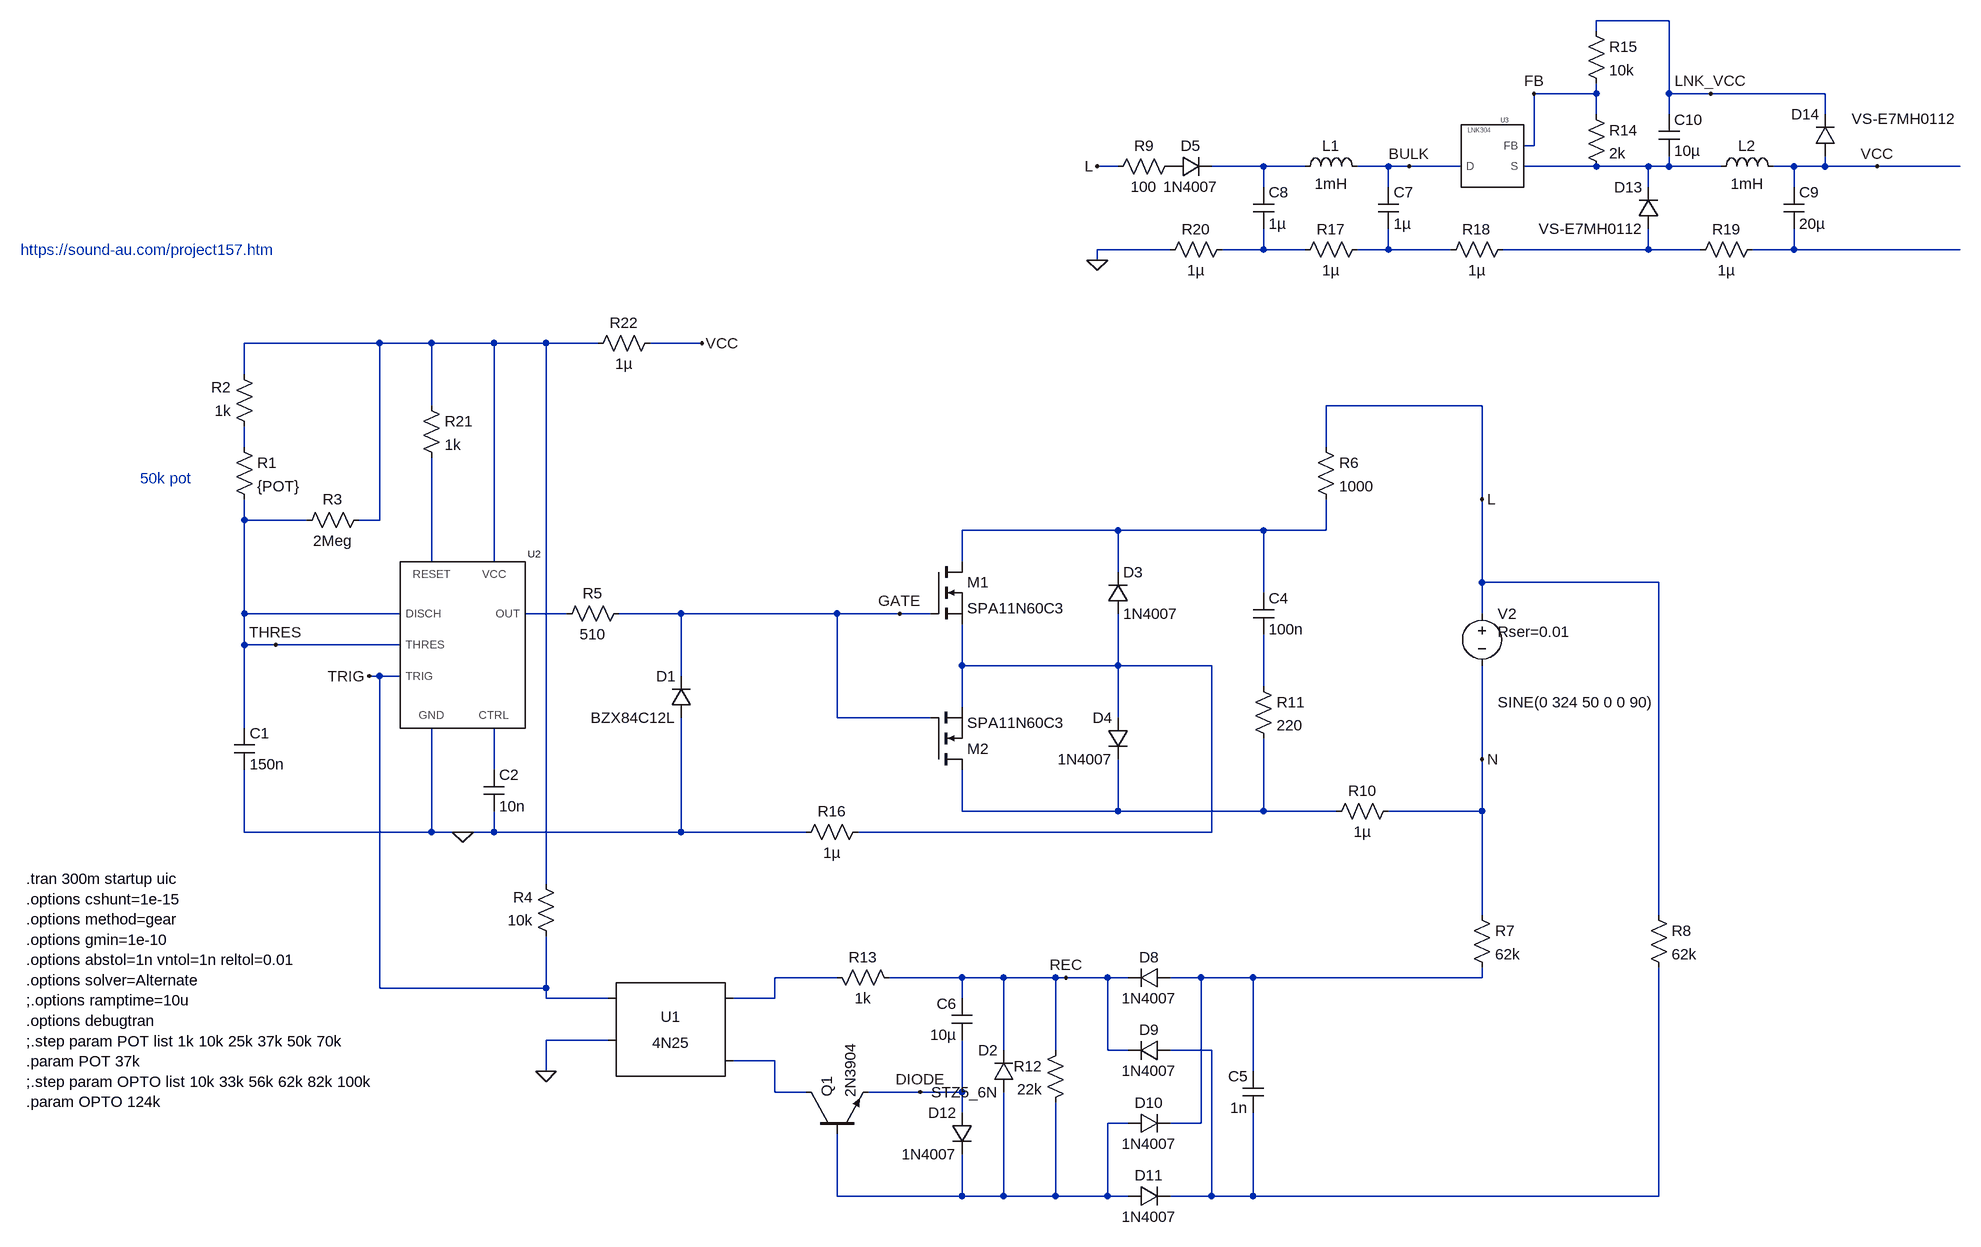
[diagram p0: schematic dimmer_trailing_edge_7555_LNK304.asc]
dimmer_trailing_edge_7555_LNK304.asc, the LTspice schematic file:
Version 4.1
SHEET 1 3352 1504
WIRE 2800 -752 2688 -752
WIRE 2688 -736 2688 -752
WIRE 2688 -640 2688 -656
WIRE 2688 -640 2592 -640
WIRE 2800 -640 2800 -752
WIRE 2864 -640 2800 -640
WIRE 3040 -640 2864 -640
WIRE 2688 -608 2688 -640
WIRE 2800 -608 2800 -640
WIRE 3040 -608 3040 -640
WIRE 2592 -560 2592 -640
WIRE 2592 -560 2576 -560
WIRE 1952 -528 1920 -528
WIRE 2176 -528 2096 -528
WIRE 2240 -528 2176 -528
WIRE 2368 -528 2320 -528
WIRE 2400 -528 2368 -528
WIRE 2480 -528 2400 -528
WIRE 2688 -528 2576 -528
WIRE 2768 -528 2688 -528
WIRE 2800 -528 2800 -544
WIRE 2800 -528 2768 -528
WIRE 2880 -528 2800 -528
WIRE 2992 -528 2960 -528
WIRE 3040 -528 3040 -544
WIRE 3040 -528 2992 -528
WIRE 3120 -528 3040 -528
WIRE 3248 -528 3120 -528
WIRE 2176 -496 2176 -528
WIRE 2368 -496 2368 -528
WIRE 2768 -496 2768 -528
WIRE 2992 -496 2992 -528
WIRE 2032 -400 1920 -400
WIRE 2176 -400 2176 -432
WIRE 2176 -400 2112 -400
WIRE 2240 -400 2176 -400
WIRE 2368 -400 2368 -432
WIRE 2368 -400 2320 -400
WIRE 2464 -400 2368 -400
WIRE 2768 -400 2768 -432
WIRE 2768 -400 2544 -400
WIRE 2848 -400 2768 -400
WIRE 2992 -400 2992 -432
WIRE 2992 -400 2928 -400
WIRE 3248 -400 2992 -400
WIRE 1920 -384 1920 -400
WIRE 816 -256 608 -256
WIRE 896 -256 816 -256
WIRE 992 -256 896 -256
WIRE 1072 -256 992 -256
WIRE 1152 -256 1072 -256
WIRE 1312 -256 1232 -256
WIRE 608 -208 608 -256
WIRE 896 -160 896 -256
WIRE 2512 -160 2272 -160
WIRE 608 -96 608 -128
WIRE 2272 -96 2272 -160
WIRE 2512 -16 2512 -160
WIRE 608 16 608 -16
WIRE 704 16 608 16
WIRE 816 16 816 -256
WIRE 816 16 784 16
WIRE 1952 32 1712 32
WIRE 2176 32 1952 32
WIRE 2272 32 2272 -16
WIRE 2272 32 2176 32
WIRE 896 80 896 -80
WIRE 992 80 992 -256
WIRE 1712 80 1712 32
WIRE 1952 96 1952 32
WIRE 2512 112 2512 -16
WIRE 2784 112 2512 112
WIRE 2176 128 2176 32
WIRE 608 160 608 16
WIRE 848 160 608 160
WIRE 1104 160 1040 160
WIRE 1280 160 1184 160
WIRE 1520 160 1280 160
WIRE 1616 160 1520 160
WIRE 1664 160 1616 160
WIRE 2512 160 2512 112
WIRE 608 208 608 160
WIRE 656 208 608 208
WIRE 848 208 656 208
WIRE 1712 240 1712 176
WIRE 1952 240 1952 160
WIRE 1952 240 1712 240
WIRE 2096 240 1952 240
WIRE 816 256 800 256
WIRE 848 256 816 256
WIRE 1280 256 1280 160
WIRE 2176 272 2176 192
WIRE 1712 304 1712 240
WIRE 1520 320 1520 160
WIRE 1664 320 1520 320
WIRE 1952 320 1952 240
WIRE 608 336 608 208
WIRE 2512 384 2512 240
WIRE 992 400 992 336
WIRE 1712 464 1712 400
WIRE 1952 464 1952 384
WIRE 1952 464 1712 464
WIRE 2176 464 2176 352
WIRE 2176 464 1952 464
WIRE 2288 464 2176 464
WIRE 2512 464 2512 384
WIRE 2512 464 2368 464
WIRE 608 496 608 400
WIRE 896 496 896 336
WIRE 896 496 608 496
WIRE 944 496 896 496
WIRE 992 496 992 464
WIRE 992 496 944 496
WIRE 1280 496 1280 320
WIRE 1280 496 992 496
WIRE 1472 496 1280 496
WIRE 2096 496 2096 240
WIRE 2096 496 1552 496
WIRE 1072 576 1072 -256
WIRE 2512 624 2512 464
WIRE 2784 624 2784 112
WIRE 1520 720 1424 720
WIRE 1712 720 1600 720
WIRE 1776 720 1712 720
WIRE 1856 720 1776 720
WIRE 1872 720 1856 720
WIRE 1936 720 1872 720
WIRE 1968 720 1936 720
WIRE 2080 720 2032 720
WIRE 2160 720 2080 720
WIRE 2512 720 2512 704
WIRE 2512 720 2160 720
WIRE 816 736 816 256
WIRE 1072 736 1072 656
WIRE 1072 736 816 736
WIRE 1072 752 1072 736
WIRE 1168 752 1072 752
WIRE 1424 752 1424 720
WIRE 1424 752 1360 752
WIRE 1712 752 1712 720
WIRE 1168 816 1072 816
WIRE 1776 832 1776 720
WIRE 1856 832 1856 720
WIRE 1936 832 1936 720
WIRE 1968 832 1936 832
WIRE 2096 832 2032 832
WIRE 1424 848 1360 848
WIRE 1072 864 1072 816
WIRE 2160 864 2160 720
WIRE 1424 896 1424 848
WIRE 1472 896 1424 896
WIRE 1648 896 1568 896
WIRE 1712 896 1712 816
WIRE 1712 896 1648 896
WIRE 1712 928 1712 896
WIRE 1968 944 1936 944
WIRE 2080 944 2080 720
WIRE 2080 944 2032 944
WIRE 1520 1056 1520 960
WIRE 1712 1056 1712 992
WIRE 1712 1056 1520 1056
WIRE 1776 1056 1776 896
WIRE 1776 1056 1712 1056
WIRE 1856 1056 1856 912
WIRE 1856 1056 1776 1056
WIRE 1936 1056 1936 944
WIRE 1936 1056 1856 1056
WIRE 1968 1056 1936 1056
WIRE 2096 1056 2096 832
WIRE 2096 1056 2032 1056
WIRE 2160 1056 2160 928
WIRE 2160 1056 2096 1056
WIRE 2784 1056 2784 704
WIRE 2784 1056 2160 1056
FLAG 944 496 0
FLAG 2512 384 N
FLAG 2512 -16 L
FLAG 1616 160 GATE
FLAG 800 256 TRIG
FLAG 656 208 THRES
FLAG 1312 -256 VCC
FLAG 1648 896 DIODE
FLAG 1872 720 REC
FLAG 1072 864 0
FLAG 1920 -384 0
FLAG 2864 -640 LNK_VCC
FLAG 2592 -640 FB
FLAG 2400 -528 BULK
FLAG 1920 -528 L
FLAG 3120 -528 VCC
SYMBOL res 592 -112 R0
SYMATTR InstName R1
SYMATTR Value {POT}
SYMBOL res 624 -112 R180
WINDOW 0 36 76 Left 2
WINDOW 3 36 40 Left 2
SYMATTR InstName R2
SYMATTR Value 1k
SYMBOL res 800 0 R90
WINDOW 0 0 56 VBottom 2
WINDOW 3 32 56 VTop 2
SYMATTR InstName R3
SYMATTR Value 2Meg
SYMBOL res 1088 672 R180
WINDOW 0 36 76 Left 2
WINDOW 3 36 40 Left 2
SYMATTR InstName R4
SYMATTR Value 10k
SYMBOL Optos\\4N25 1264 816 M0
SYMATTR InstName U1
SYMBOL cap 592 336 R0
SYMATTR InstName C1
SYMATTR Value 150n
SYMATTR SpiceLine Rser=0.1
SYMBOL cap 976 400 R0
SYMATTR InstName C2
SYMATTR Value 10n
SYMATTR SpiceLine Rser=0.1
SYMBOL res 1200 144 R90
WINDOW 0 0 56 VBottom 2
WINDOW 3 32 56 VTop 2
SYMATTR InstName R5
SYMATTR Value 510
SYMBOL diode 1296 320 R180
WINDOW 0 24 64 Left 2
WINDOW 3 24 0 Left 2
SYMATTR InstName D1
SYMATTR Value BZX84C12L
SYMBOL nmos 1664 80 R0
SYMATTR InstName M1
SYMATTR Value SPA11N60C3
SYMBOL nmos 1664 400 M180
SYMATTR InstName M2
SYMATTR Value SPA11N60C3
SYMBOL voltage 2512 144 R0
WINDOW 3 24 152 Left 2
WINDOW 123 24 124 Left 2
WINDOW 39 24 44 Left 2
SYMATTR Value SINE(0 324 50 0 0 90)
SYMATTR SpiceLine Rser=0.01
SYMATTR InstName V2
SYMBOL res 2256 -112 R0
SYMATTR InstName R6
SYMATTR Value 1000
SYMBOL TLC555 944 208 R0
SYMATTR InstName U2
SYMBOL cap 2160 128 R0
SYMATTR InstName C4
SYMATTR Value 100n
SYMBOL res 2160 256 R0
SYMATTR InstName R11
SYMATTR Value 220
SYMBOL cap 2176 864 M0
SYMATTR InstName C5
SYMATTR Value 1n
SYMBOL diode 2032 736 M270
WINDOW 0 32 32 VTop 2
WINDOW 3 0 32 VBottom 2
SYMATTR InstName D8
SYMATTR Value 1N4007
SYMBOL diode 2032 848 M270
WINDOW 0 32 32 VTop 2
WINDOW 3 0 32 VBottom 2
SYMATTR InstName D9
SYMATTR Value 1N4007
SYMBOL diode 1968 928 M90
WINDOW 0 0 32 VBottom 2
WINDOW 3 32 32 VTop 2
SYMATTR InstName D10
SYMATTR Value 1N4007
SYMBOL diode 1968 1040 M90
WINDOW 0 0 32 VBottom 2
WINDOW 3 32 32 VTop 2
SYMATTR InstName D11
SYMATTR Value 1N4007
SYMBOL res 1872 816 M0
SYMATTR InstName R12
SYMATTR Value 22k
SYMBOL cap 1728 752 M0
SYMATTR InstName C6
SYMATTR Value 10µ
SYMATTR SpiceLine V=10
SYMBOL diode 1728 928 M0
SYMATTR InstName D12
SYMATTR Value 1N4007
SYMBOL npn 1472 960 R270
SYMATTR InstName Q1
SYMATTR Value 2N3904
SYMBOL res 1504 704 M90
WINDOW 0 0 56 VBottom 2
WINDOW 3 32 56 VTop 2
SYMATTR InstName R13
SYMATTR Value 1k
SYMBOL res 2496 608 R0
SYMATTR InstName R7
SYMATTR Value 62k
SYMBOL res 2768 608 R0
SYMATTR InstName R8
SYMATTR Value 62k
SYMBOL diode 1792 896 R180
WINDOW 0 24 64 Left 2
WINDOW 3 24 0 Left 2
SYMATTR InstName D2
SYMATTR Value STZ5_6N
SYMBOL diode 1936 160 M180
WINDOW 0 24 64 Left 2
WINDOW 3 24 0 Left 2
SYMATTR InstName D3
SYMATTR Value 1N4007
SYMBOL diode 1968 320 M0
SYMATTR InstName D4
SYMATTR Value 1N4007
SYMBOL LNK304 2528 -544 R0
SYMATTR InstName U3
SYMBOL cap 2352 -496 R0
SYMATTR InstName C7
SYMATTR Value 1µ
SYMATTR SpiceLine V=400 Rser=20
SYMBOL cap 2160 -496 R0
SYMATTR InstName C8
SYMATTR Value 1µ
SYMATTR SpiceLine V=400 Rser=20
SYMBOL ind 2224 -512 R270
WINDOW 0 32 56 VTop 2
WINDOW 3 5 56 VBottom 2
SYMATTR InstName L1
SYMATTR Value 1mH
SYMATTR SpiceLine Rser=3
SYMBOL diode 2032 -512 R270
WINDOW 0 32 32 VTop 2
WINDOW 3 0 32 VBottom 2
SYMATTR InstName D5
SYMATTR Value 1N4007
SYMBOL diode 2784 -432 R180
WINDOW 0 24 64 Left 2
WINDOW 3 24 0 Left 2
SYMATTR InstName D13
SYMATTR Value VS-E7MH0112
SYMBOL diode 3056 -544 R180
WINDOW 0 24 64 Left 2
WINDOW 3 -185 57 Left 2
SYMATTR InstName D14
SYMATTR Value VS-E7MH0112
SYMBOL cap 2976 -496 R0
SYMATTR InstName C9
SYMATTR Value 20µ
SYMATTR SpiceLine V=25 Rser=0.3
SYMBOL ind 2864 -512 R270
WINDOW 0 32 56 VTop 2
WINDOW 3 5 56 VBottom 2
SYMATTR InstName L2
SYMATTR Value 1mH
SYMATTR SpiceLine Rser=3
SYMBOL cap 2784 -608 R0
SYMATTR InstName C10
SYMATTR Value 10µ
SYMATTR SpiceLine V=25 Rser=0.3
SYMBOL res 2672 -624 R0
SYMATTR InstName R14
SYMATTR Value 2k
SYMBOL res 2672 -752 R0
SYMATTR InstName R15
SYMATTR Value 10k
SYMBOL res 1936 -512 R270
WINDOW 0 32 56 VTop 2
WINDOW 3 0 56 VBottom 2
SYMATTR InstName R9
SYMATTR Value 100
SYMBOL res 2272 480 R270
WINDOW 0 32 56 VTop 2
WINDOW 3 0 56 VBottom 2
SYMATTR InstName R10
SYMATTR Value 1µ
SYMBOL res 1456 512 R270
WINDOW 0 32 56 VTop 2
WINDOW 3 0 56 VBottom 2
SYMATTR InstName R16
SYMATTR Value 1µ
SYMBOL res 2336 -416 R90
WINDOW 0 0 56 VBottom 2
WINDOW 3 32 56 VTop 2
SYMATTR InstName R17
SYMATTR Value 1µ
SYMBOL res 2560 -416 R90
WINDOW 0 0 56 VBottom 2
WINDOW 3 32 56 VTop 2
SYMATTR InstName R18
SYMATTR Value 1µ
SYMBOL res 2944 -416 R90
WINDOW 0 0 56 VBottom 2
WINDOW 3 32 56 VTop 2
SYMATTR InstName R19
SYMATTR Value 1µ
SYMBOL res 2128 -416 R90
WINDOW 0 0 56 VBottom 2
WINDOW 3 32 56 VTop 2
SYMATTR InstName R20
SYMATTR Value 1µ
SYMBOL res 880 -176 R0
SYMATTR InstName R21
SYMATTR Value 1k
SYMBOL res 1248 -272 R90
WINDOW 0 0 56 VBottom 2
WINDOW 3 32 56 VTop 2
SYMATTR InstName R22
SYMATTR Value 1µ
TEXT 264 -400 Left 2 ;https://sound-au.com/project157.htm
TEXT 272 568 Left 2 !.tran 300m startup uic\n.options cshunt=1e-15\n.options method=gear\n.options gmin=1e-10\n.options abstol=1n vntol=1n reltol=0.01\n.options solver=Alternate\n;.options ramptime=10u\n.options debugtran\n;.step param POT list 1k 10k 25k 37k 50k 70k\n.param POT 37k\n;.step param OPTO list 10k 33k 56k 62k 82k 100k\n.param OPTO 124k
TEXT 448 -48 Left 2 ;50k pot

The netlist it stands for:
* dimmer_trailing_edge_7555_LNK304.asc
R1 N008 THRES {POT}
R2 N008 N007 1k
R3 N007 THRES 2Meg
R4 TRIG N007 10k
X§U1 N016 N019 TRIG 0 NC_01 4N25
C1 THRES 0 150n Rser=0.1
C2 N014 0 10n Rser=0.1
R5 GATE N011 510
D1 0 GATE BZX84C12L
M1 N009 GATE N012 N012 SPA11N60C3
M2 N015 GATE N012 N012 SPA11N60C3
V2 L N SINE(0 324 50 0 0 90) Rser=0.01
R6 L N009 1000
X§U2 THRES N014 TRIG N010 N011 THRES N007 0 TLC555_6  ; pins THRES CTRL TRIG RESET OUT DISCH VCC GND
C4 N009 N013 100n
R11 N013 N015 220
C5 N017 N018 1n
D8 N017 REC 1N4007
D9 N018 REC 1N4007
D10 N020 N017 1N4007
D11 N020 N018 1N4007
R12 REC N020 22k
C6 REC DIODE 10µ V=10
D12 DIODE N020 1N4007
Q1 N019 N020 DIODE 0 2N3904
R13 N016 REC 1k
R7 N N017 62k
R8 L N018 62k
D2 N020 REC STZ5_6N
D3 N012 N009 1N4007
D4 N012 N015 1N4007
X§U3 BULK FB N002 LNK304  ; pins D FB S
C7 BULK N004 1µ V=400 Rser=20
C8 N001 N003 1µ V=400 Rser=20
L1 N001 BULK 1mH Rser=3
D5 P001 N001 1N4007
D13 N005 N002 VS-E7MH0112
D14 VCC LNK_VCC VS-E7MH0112
C9 VCC N006 20µ V=25 Rser=0.3
L2 N002 VCC 1mH Rser=3
C10 LNK_VCC N002 10µ V=25 Rser=0.3
R14 FB N002 2k
R15 LNK_VCC FB 10k
R9 L P001 100
R10 N015 N 1µ
R16 0 N012 1µ
R17 N004 N003 1µ
R18 N005 N004 1µ
R19 N006 N005 1µ
R20 N003 0 1µ
R21 N007 N010 1k
R22 VCC N007 1µ
.model D D
.lib standard.dio
.model NPN NPN
.model PNP PNP
.lib standard.bjt
.model NMOS NMOS
.model PMOS PMOS
.lib standard.mos
* https://sound-au.com/project157.htm
.tran 300m startup uic
.options cshunt=1e-15
.options method=gear
.options gmin=1e-10
.options abstol=1n vntol=1n reltol=0.01
.options solver=Alternate
;.options ramptime=10u
.options debugtran
;.step param POT list 1k 10k 25k 37k 50k 70k
.param POT 37k
;.step param OPTO list 10k 33k 56k 62k 82k 100k
.param OPTO 124k
* 50k pot
.lib 4N25.sub
.lib TLC555_6.LIB
.lib LNK304.sub
.backanno
.end